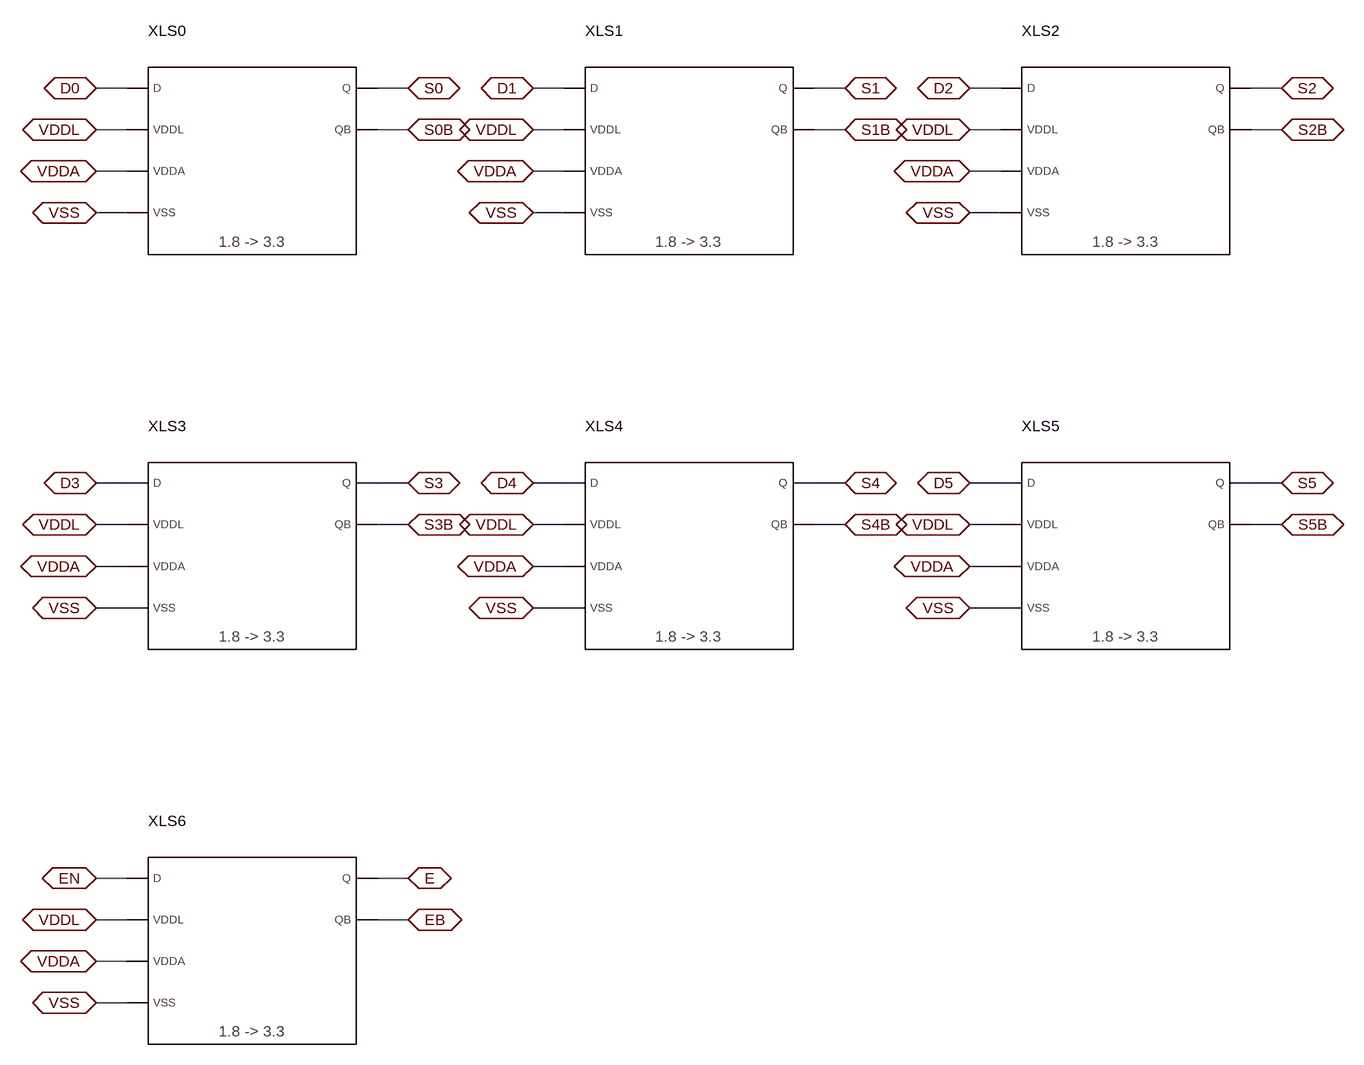
[diagram p0: schematic DAC_Control.asc]
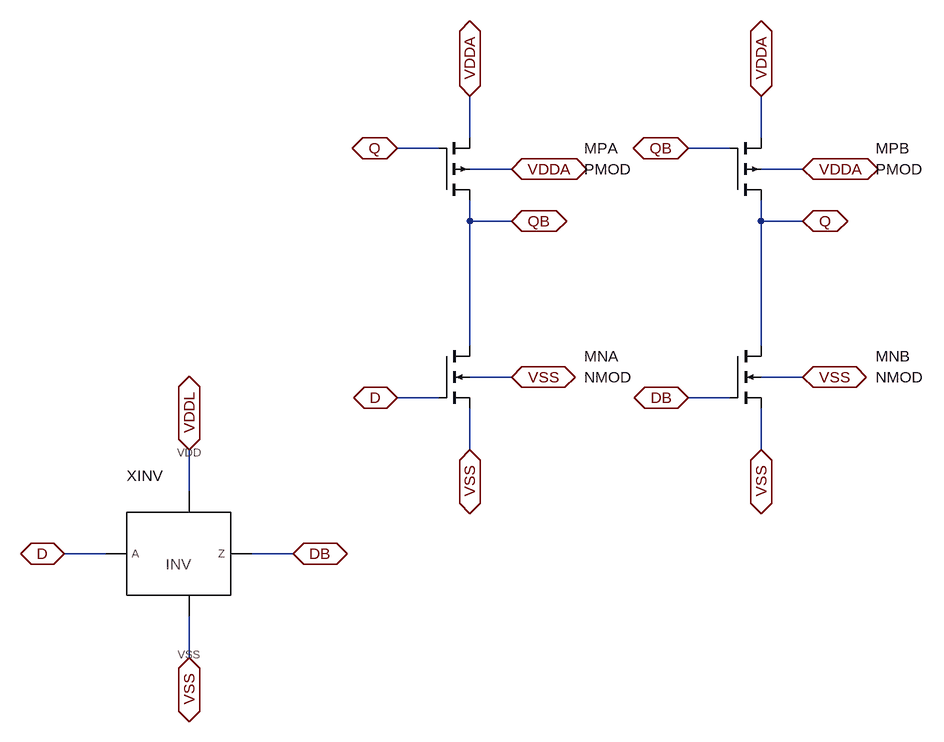
[diagram p1: sub-circuit dac_levelshift.asc]
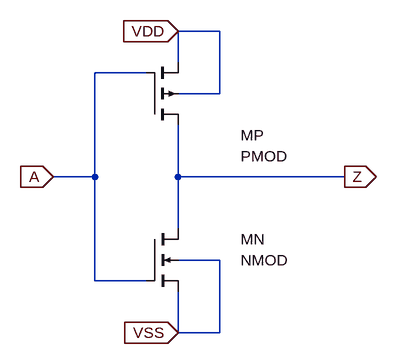
[diagram p2: sub-circuit cmos_inv.asc]
DAC_Control.asc, the LTspice schematic file:
Version 4.1
SHEET 1 2208 1952
WIRE 192 160 144 160
WIRE 192 224 144 224
WIRE 192 288 144 288
WIRE 192 352 144 352
WIRE 576 160 624 160
WIRE 576 224 624 224
WIRE 864 160 816 160
WIRE 864 224 816 224
WIRE 864 288 816 288
WIRE 864 352 816 352
WIRE 1248 160 1296 160
WIRE 1248 224 1296 224
WIRE 1536 160 1488 160
WIRE 1536 224 1488 224
WIRE 1536 288 1488 288
WIRE 1536 352 1488 352
WIRE 1920 160 1968 160
WIRE 1920 224 1968 224
WIRE 192 768 144 768
WIRE 192 832 144 832
WIRE 192 896 144 896
WIRE 192 960 144 960
WIRE 576 768 624 768
WIRE 576 832 624 832
WIRE 864 768 816 768
WIRE 864 832 816 832
WIRE 864 896 816 896
WIRE 864 960 816 960
WIRE 1248 768 1296 768
WIRE 1248 832 1296 832
WIRE 1536 768 1488 768
WIRE 1536 832 1488 832
WIRE 1536 896 1488 896
WIRE 1536 960 1488 960
WIRE 1920 768 1968 768
WIRE 1920 832 1968 832
WIRE 192 1376 144 1376
WIRE 192 1440 144 1440
WIRE 192 1504 144 1504
WIRE 192 1568 144 1568
WIRE 576 1376 624 1376
WIRE 576 1440 624 1440
FLAG 144 160 D0
IOPIN 144 160 BiDir
FLAG 144 224 VDDL
IOPIN 144 224 BiDir
FLAG 144 288 VDDA
IOPIN 144 288 BiDir
FLAG 144 352 VSS
IOPIN 144 352 BiDir
FLAG 624 160 S0
IOPIN 624 160 BiDir
FLAG 624 224 S0B
IOPIN 624 224 BiDir
FLAG 816 160 D1
IOPIN 816 160 BiDir
FLAG 816 224 VDDL
IOPIN 816 224 BiDir
FLAG 816 288 VDDA
IOPIN 816 288 BiDir
FLAG 816 352 VSS
IOPIN 816 352 BiDir
FLAG 1296 160 S1
IOPIN 1296 160 BiDir
FLAG 1296 224 S1B
IOPIN 1296 224 BiDir
FLAG 1488 160 D2
IOPIN 1488 160 BiDir
FLAG 1488 224 VDDL
IOPIN 1488 224 BiDir
FLAG 1488 288 VDDA
IOPIN 1488 288 BiDir
FLAG 1488 352 VSS
IOPIN 1488 352 BiDir
FLAG 1968 160 S2
IOPIN 1968 160 BiDir
FLAG 1968 224 S2B
IOPIN 1968 224 BiDir
FLAG 144 768 D3
IOPIN 144 768 BiDir
FLAG 144 832 VDDL
IOPIN 144 832 BiDir
FLAG 144 896 VDDA
IOPIN 144 896 BiDir
FLAG 144 960 VSS
IOPIN 144 960 BiDir
FLAG 624 768 S3
IOPIN 624 768 BiDir
FLAG 624 832 S3B
IOPIN 624 832 BiDir
FLAG 816 768 D4
IOPIN 816 768 BiDir
FLAG 816 832 VDDL
IOPIN 816 832 BiDir
FLAG 816 896 VDDA
IOPIN 816 896 BiDir
FLAG 816 960 VSS
IOPIN 816 960 BiDir
FLAG 1296 768 S4
IOPIN 1296 768 BiDir
FLAG 1296 832 S4B
IOPIN 1296 832 BiDir
FLAG 1488 768 D5
IOPIN 1488 768 BiDir
FLAG 1488 832 VDDL
IOPIN 1488 832 BiDir
FLAG 1488 896 VDDA
IOPIN 1488 896 BiDir
FLAG 1488 960 VSS
IOPIN 1488 960 BiDir
FLAG 1968 768 S5
IOPIN 1968 768 BiDir
FLAG 1968 832 S5B
IOPIN 1968 832 BiDir
FLAG 144 1376 EN
IOPIN 144 1376 BiDir
FLAG 144 1440 VDDL
IOPIN 144 1440 BiDir
FLAG 144 1504 VDDA
IOPIN 144 1504 BiDir
FLAG 144 1568 VSS
IOPIN 144 1568 BiDir
FLAG 624 1376 E
IOPIN 624 1376 BiDir
FLAG 624 1440 EB
IOPIN 624 1440 BiDir
SYMBOL DAC_LevelShift 192 96 R0
WINDOW 0 32 -24 Left 2
SYMATTR InstName XLS0
SYMBOL DAC_LevelShift 864 96 R0
WINDOW 0 32 -24 Left 2
SYMATTR InstName XLS1
SYMBOL DAC_LevelShift 1536 96 R0
WINDOW 0 32 -24 Left 2
SYMATTR InstName XLS2
SYMBOL DAC_LevelShift 192 704 R0
WINDOW 0 32 -24 Left 2
SYMATTR InstName XLS3
SYMBOL DAC_LevelShift 864 704 R0
WINDOW 0 32 -24 Left 2
SYMATTR InstName XLS4
SYMBOL DAC_LevelShift 1536 704 R0
WINDOW 0 32 -24 Left 2
SYMATTR InstName XLS5
SYMBOL DAC_LevelShift 192 1312 R0
WINDOW 0 32 -24 Left 2
SYMATTR InstName XLS6

dac_levelshift.asc, the sub-circuit schematic file:
Version 4.1
SHEET 1 1632 1136
WIRE 192 832 128 832
WIRE 416 832 480 832
WIRE 320 736 320 672
WIRE 320 928 320 992
WIRE 752 192 752 128
WIRE 752 240 816 240
WIRE 704 208 640 208
WIRE 752 288 752 336
WIRE 752 320 816 320
WIRE 752 336 752 512
WIRE 704 592 640 592
WIRE 752 560 816 560
WIRE 752 608 752 672
WIRE 1200 192 1200 128
WIRE 1200 240 1264 240
WIRE 1152 208 1088 208
WIRE 1200 288 1200 336
WIRE 1200 320 1264 320
WIRE 1200 336 1200 512
WIRE 1152 592 1088 592
WIRE 1200 560 1264 560
WIRE 1200 608 1200 672
FLAG 128 832 D
IOPIN 128 832 BiDir
FLAG 480 832 DB
IOPIN 480 832 BiDir
FLAG 320 672 VDDL
IOPIN 320 672 BiDir
FLAG 320 992 VSS
IOPIN 320 992 BiDir
FLAG 752 128 VDDA
IOPIN 752 128 BiDir
FLAG 816 240 VDDA
IOPIN 816 240 BiDir
FLAG 640 208 Q
IOPIN 640 208 BiDir
FLAG 816 320 QB
IOPIN 816 320 BiDir
FLAG 640 592 D
IOPIN 640 592 BiDir
FLAG 816 560 VSS
IOPIN 816 560 BiDir
FLAG 752 672 VSS
IOPIN 752 672 BiDir
FLAG 1200 128 VDDA
IOPIN 1200 128 BiDir
FLAG 1264 240 VDDA
IOPIN 1264 240 BiDir
FLAG 1088 208 QB
IOPIN 1088 208 BiDir
FLAG 1264 320 Q
IOPIN 1264 320 BiDir
FLAG 1088 592 DB
IOPIN 1088 592 BiDir
FLAG 1264 560 VSS
IOPIN 1264 560 BiDir
FLAG 1200 672 VSS
IOPIN 1200 672 BiDir
SYMBOL CMOS_INV 192 736 R0
WINDOW 0 32 -24 Left 2
SYMATTR InstName XINV
SYMBOL pmos4 704 288 M180
WINDOW 0 224 80 Left 2
WINDOW 3 224 48 Left 2
SYMATTR InstName MPA
SYMATTR Value PMOD
SYMATTR SpiceLine W=4u L=1u
SYMBOL nmos4 704 512 R0
WINDOW 0 224 16 Left 2
WINDOW 3 224 48 Left 2
SYMATTR InstName MNA
SYMATTR Value NMOD
SYMATTR SpiceLine W=40u L=1u
SYMBOL pmos4 1152 288 M180
WINDOW 0 224 80 Left 2
WINDOW 3 224 48 Left 2
SYMATTR InstName MPB
SYMATTR Value PMOD
SYMATTR SpiceLine W=4u L=1u
SYMBOL nmos4 1152 512 R0
WINDOW 0 224 16 Left 2
WINDOW 3 224 48 Left 2
SYMATTR InstName MNB
SYMATTR Value NMOD
SYMATTR SpiceLine W=40u L=1u

cmos_inv.asc, the sub-circuit schematic file:
Version 4.1
SHEET 1 800 640
WIRE 352 192 352 272
WIRE 352 272 352 352
WIRE 352 272 608 272
WIRE 304 112 224 112
WIRE 224 112 224 272
WIRE 224 272 224 432
WIRE 224 432 304 432
WIRE 224 272 160 272
WIRE 352 96 352 48
WIRE 352 144 416 144
WIRE 416 144 416 48
WIRE 416 48 352 48
WIRE 352 448 352 512
WIRE 352 400 416 400
WIRE 416 400 416 512
WIRE 416 512 352 512
FLAG 608 272 Z
IOPIN 608 272 Out
FLAG 160 272 A
IOPIN 160 272 In
FLAG 352 48 VDD
IOPIN 352 48 In
FLAG 352 512 VSS
IOPIN 352 512 In
SYMBOL pmos4 304 192 M180
WINDOW 0 144 -16 Left 2
WINDOW 3 144 -48 Left 2
SYMATTR InstName MP
SYMATTR Value PMOD
SYMATTR SpiceLine W=20u L=1u
SYMBOL nmos4 304 352 R0
WINDOW 0 144 16 Left 2
WINDOW 3 144 48 Left 2
SYMATTR InstName MN
SYMATTR Value NMOD
SYMATTR SpiceLine W=10u L=1u

The netlist it stands for:
* DAC_Control.asc
X§XLS0 D0 VDDL VDDA VSS S0 S0B dac_levelshift
X§XLS1 D1 VDDL VDDA VSS S1 S1B dac_levelshift
X§XLS2 D2 VDDL VDDA VSS S2 S2B dac_levelshift
X§XLS3 D3 VDDL VDDA VSS S3 S3B dac_levelshift
X§XLS4 D4 VDDL VDDA VSS S4 S4B dac_levelshift
X§XLS5 D5 VDDL VDDA VSS S5 S5B dac_levelshift
X§XLS6 EN VDDL VDDA VSS E EB dac_levelshift

* block symbol definitions
.subckt dac_levelshift D VDDL VDDA VSS Q QB
X§XINV D DB VDDL VSS cmos_inv
MPA QB Q VDDA VDDA PMOD W=4u L=1u
MNA QB D VSS VSS NMOD W=40u L=1u
MPB Q QB VDDA VDDA PMOD W=4u L=1u
MNB Q DB VSS VSS NMOD W=40u L=1u
.ends dac_levelshift

.subckt cmos_inv A Z VDD VSS
MP Z A VDD VDD PMOD W=20u L=1u
MN Z A VSS VSS NMOD W=10u L=1u
.ends cmos_inv

.model NMOS NMOS
.model PMOS PMOS
.lib standard.mos
.backanno
.end